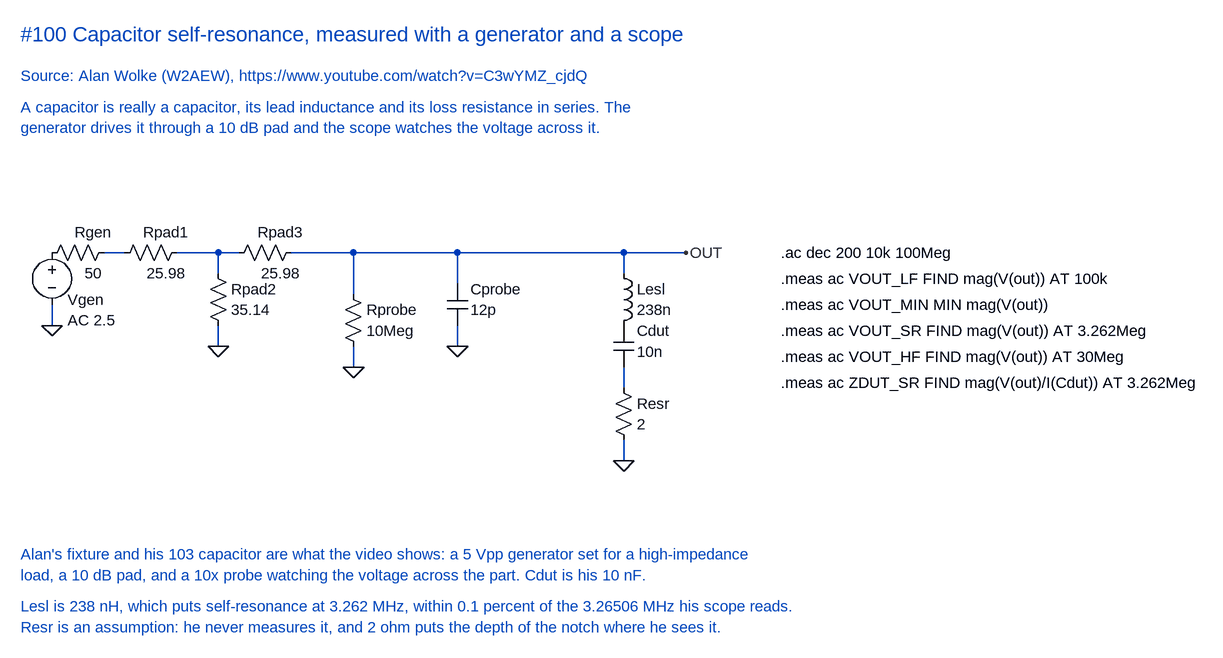
[diagram p0: schematic Capacitor self-resonance fixture.asc]
Capacitor self-resonance fixture.asc, the LTspice schematic file:
Version 4
SHEET 1 2200 1100
WIRE 288 336 320 336
WIRE 400 336 464 336
WIRE 464 336 496 336
WIRE 464 336 464 368
WIRE 464 448 464 480
WIRE 208 416 208 448
WIRE 576 336 672 336
WIRE 672 336 832 336
WIRE 832 336 1088 336
WIRE 1088 336 1184 336
WIRE 672 336 672 400
WIRE 672 480 672 512
WIRE 832 336 832 384
WIRE 832 448 832 480
WIRE 1088 336 1088 368
WIRE 1088 512 1088 544
WIRE 1088 624 1088 656
FLAG 208 448 0
FLAG 464 480 0
FLAG 672 512 0
FLAG 832 480 0
FLAG 1088 656 0
FLAG 1184 336 OUT
SYMBOL voltage 208 320 R0
WINDOW 0 24 88 Left 2
WINDOW 3 24 120 Left 2
SYMATTR InstName Vgen
SYMATTR Value AC 2.5
SYMBOL res 304 320 R90
WINDOW 0 0 32 VBottom 2
WINDOW 3 32 32 VTop 2
SYMATTR InstName Rgen
SYMATTR Value 50
SYMBOL res 416 320 R90
WINDOW 0 0 32 VBottom 2
WINDOW 3 32 32 VTop 2
SYMATTR InstName Rpad1
SYMATTR Value 25.98
SYMBOL res 448 352 R0
WINDOW 0 36 40 Left 2
WINDOW 3 36 72 Left 2
SYMATTR InstName Rpad2
SYMATTR Value 35.14
SYMBOL res 592 320 R90
WINDOW 0 0 32 VBottom 2
WINDOW 3 32 32 VTop 2
SYMATTR InstName Rpad3
SYMATTR Value 25.98
SYMBOL res 656 384 R0
WINDOW 0 36 40 Left 2
WINDOW 3 36 72 Left 2
SYMATTR InstName Rprobe
SYMATTR Value 10Meg
SYMBOL cap 816 384 R0
WINDOW 0 36 8 Left 2
WINDOW 3 36 40 Left 2
SYMATTR InstName Cprobe
SYMATTR Value 12p
SYMBOL ind 1072 352 R0
WINDOW 0 36 40 Left 2
WINDOW 3 36 72 Left 2
SYMATTR InstName Lesl
SYMATTR Value 238n
SYMBOL cap 1072 448 R0
WINDOW 0 36 8 Left 2
WINDOW 3 36 40 Left 2
SYMATTR InstName Cdut
SYMATTR Value 10n
SYMBOL res 1072 528 R0
WINDOW 0 36 40 Left 2
WINDOW 3 36 72 Left 2
SYMATTR InstName Resr
SYMATTR Value 2
TEXT 160 0 Left 3 ;#100 Capacitor self-resonance, measured with a generator and a scope
TEXT 160 64 Left 2 ;Source: Alan Wolke (W2AEW), https://www.youtube.com/watch?v=C3wYMZ_cjdQ
TEXT 160 112 Left 2 ;A capacitor is really a capacitor, its lead inductance and its loss resistance in series. The
TEXT 160 144 Left 2 ;generator drives it through a 10 dB pad and the scope watches the voltage across it.
TEXT 1330 336 Left 2 !.ac dec 200 10k 100Meg
TEXT 1330 376 Left 2 !.meas ac VOUT_LF FIND mag(V(out)) AT 100k
TEXT 1330 416 Left 2 !.meas ac VOUT_MIN MIN mag(V(out))
TEXT 1330 456 Left 2 !.meas ac VOUT_SR FIND mag(V(out)) AT 3.262Meg
TEXT 1330 496 Left 2 !.meas ac VOUT_HF FIND mag(V(out)) AT 30Meg
TEXT 1330 536 Left 2 !.meas ac ZDUT_SR FIND mag(V(out)/I(Cdut)) AT 3.262Meg
TEXT 160 800 Left 2 ;Alan's fixture and his 103 capacitor are what the video shows: a 5 Vpp generator set for a high-impedance
TEXT 160 832 Left 2 ;load, a 10 dB pad, and a 10x probe watching the voltage across the part. Cdut is his 10 nF.
TEXT 160 880 Left 2 ;Lesl is 238 nH, which puts self-resonance at 3.262 MHz, within 0.1 percent of the 3.26506 MHz his scope reads.
TEXT 160 912 Left 2 ;Resr is an assumption: he never measures it, and 2 ohm puts the depth of the notch where he sees it.

The netlist it stands for:
* Capacitor self-resonance fixture.asc
Vgen P001 0 AC 2.5
Rgen N001 P001 50
Rpad1 N002 N001 25.98
Rpad2 N002 0 35.14
Rpad3 OUT N002 25.98
Rprobe OUT 0 10Meg
Cprobe OUT 0 12p
Lesl OUT P002 238n
Cdut P002 N003 10n
Resr N003 0 2
* #100 Capacitor self-resonance, measured with a generator and a scope
* Source: Alan Wolke (W2AEW), https://www.youtube.com/watch?v=C3wYMZ_cjdQ
* A capacitor is really a capacitor, its lead inductance and its loss resistance in series. The
* generator drives it through a 10 dB pad and the scope watches the voltage across it.
.ac dec 200 10k 100Meg
.meas ac VOUT_LF FIND mag(V(out)) AT 100k
.meas ac VOUT_MIN MIN mag(V(out))
.meas ac VOUT_SR FIND mag(V(out)) AT 3.262Meg
.meas ac VOUT_HF FIND mag(V(out)) AT 30Meg
.meas ac ZDUT_SR FIND mag(V(out)/I(Cdut)) AT 3.262Meg
* Alan's fixture and his 103 capacitor are what the video shows: a 5 Vpp generator set for a high-impedance
* load, a 10 dB pad, and a 10x probe watching the voltage across the part. Cdut is his 10 nF.
* Lesl is 238 nH, which puts self-resonance at 3.262 MHz, within 0.1 percent of the 3.26506 MHz his scope reads.
* Resr is an assumption: he never measures it, and 2 ohm puts the depth of the notch where he sees it.
.backanno
.end